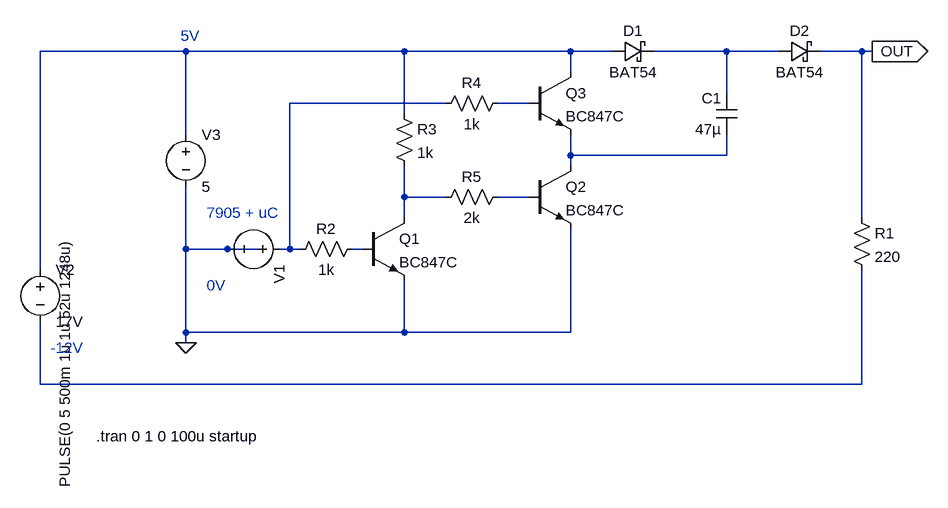
[diagram p0: schematic DriverA3-variant1.asc]
DriverA3-variant1.asc, the LTspice schematic file:
Version 4
SHEET 1 1036 692
WIRE -128 16 -352 16
WIRE 208 16 -128 16
WIRE 464 16 208 16
WIRE 528 16 464 16
WIRE 704 16 592 16
WIRE 784 16 704 16
WIRE 912 16 848 16
WIRE 928 16 912 16
WIRE 464 48 464 16
WIRE 704 80 704 16
WIRE 272 96 32 96
WIRE 400 96 352 96
WIRE 208 112 208 16
WIRE -128 144 -128 16
WIRE 464 176 464 144
WIRE 704 176 704 144
WIRE 704 176 464 176
WIRE 464 192 464 176
WIRE 208 240 208 192
WIRE 272 240 208 240
WIRE 400 240 352 240
WIRE 208 272 208 240
WIRE 912 272 912 16
WIRE -128 320 -128 224
WIRE -64 320 -128 320
WIRE -16 320 -64 320
WIRE 32 320 32 96
WIRE 32 320 16 320
WIRE 48 320 32 320
WIRE 144 320 128 320
WIRE -352 352 -352 16
WIRE -128 448 -128 320
WIRE 208 448 208 368
WIRE 208 448 -128 448
WIRE 464 448 464 288
WIRE 464 448 208 448
WIRE -128 464 -128 448
WIRE -352 528 -352 432
WIRE 912 528 912 352
WIRE 912 528 -352 528
FLAG 928 16 OUT
IOPIN 928 16 Out
FLAG -128 464 0
SYMBOL voltage 32 320 R90
WINDOW 3 -18 346 Left 2
WINDOW 123 0 0 Left 0
WINDOW 39 -4 138 Left 2
SYMATTR InstName V1
SYMATTR Value PULSE(0 5 500m 1u 1u 52u 1248u)
SYMBOL cap 720 144 R180
WINDOW 0 24 56 Left 2
WINDOW 3 24 8 Left 2
SYMATTR InstName C1
SYMATTR Value 47µ
SYMBOL schottky 528 32 R270
WINDOW 0 32 32 VTop 2
WINDOW 3 0 32 VBottom 2
SYMATTR InstName D1
SYMATTR Value BAT54
SYMATTR Description Diode
SYMATTR Type diode
SYMBOL schottky 784 32 R270
WINDOW 0 32 32 VTop 2
WINDOW 3 0 32 VBottom 2
SYMATTR InstName D2
SYMATTR Value BAT54
SYMATTR Description Diode
SYMATTR Type diode
SYMBOL voltage -352 336 R0
WINDOW 123 0 0 Left 0
WINDOW 39 24 124 Left 2
SYMATTR InstName V2
SYMATTR Value 17V
SYMBOL res 896 256 R0
SYMATTR InstName R1
SYMATTR Value 220
SYMBOL voltage -128 128 R0
WINDOW 123 0 0 Left 0
WINDOW 39 0 0 Left 0
SYMATTR InstName V3
SYMATTR Value 5
SYMBOL npn 144 272 R0
SYMATTR InstName Q1
SYMATTR Value BC847C
SYMBOL res 144 304 R90
WINDOW 0 0 56 VBottom 2
WINDOW 3 32 56 VTop 2
SYMATTR InstName R2
SYMATTR Value 1k
SYMBOL res 192 96 R0
SYMATTR InstName R3
SYMATTR Value 1k
SYMBOL npn 400 192 R0
SYMATTR InstName Q2
SYMATTR Value BC847C
SYMBOL res 368 224 R90
WINDOW 0 0 56 VBottom 2
WINDOW 3 32 56 VTop 2
SYMATTR InstName R5
SYMATTR Value 2k
SYMBOL npn 400 48 R0
SYMATTR InstName Q3
SYMATTR Value BC847C
SYMBOL res 368 80 R90
WINDOW 0 0 56 VBottom 2
WINDOW 3 32 56 VTop 2
SYMATTR InstName R4
SYMATTR Value 1k
TEXT -266 608 Left 2 !.tran 0 1 0 100u startup
TEXT -96 264 Left 2 ;7905 + uC
TEXT -136 -8 Left 2 ;5V
TEXT -96 376 Left 2 ;0V
TEXT -336 472 Left 2 ;-12V

The netlist it stands for:
* DriverA3-variant1.asc
V1 N003 0 PULSE(0 5 500m 1u 1u 52u 1248u)
C1 N005 N002 47µ
D1 N001 N002 BAT54
D2 N002 OUT BAT54
V2 N001 N009 17V
R1 OUT N009 220
V3 N001 0 5
Q1 N006 N008 0 0 BC847C
R2 N008 N003 1k
R3 N001 N006 1k
Q2 N005 N007 0 0 BC847C
R5 N007 N006 2k
Q3 N001 N004 N005 0 BC847C
R4 N004 N003 1k
.model D D
.lib standard.dio
.model NPN NPN
.model PNP PNP
.lib standard.bjt
.tran 0 1 0 100u startup
* 7905 + uC
* 5V
* 0V
* -12V
.backanno
.end